# Altium project IndoorGuide_Tag_Device_V1.0.0.PrjPcb
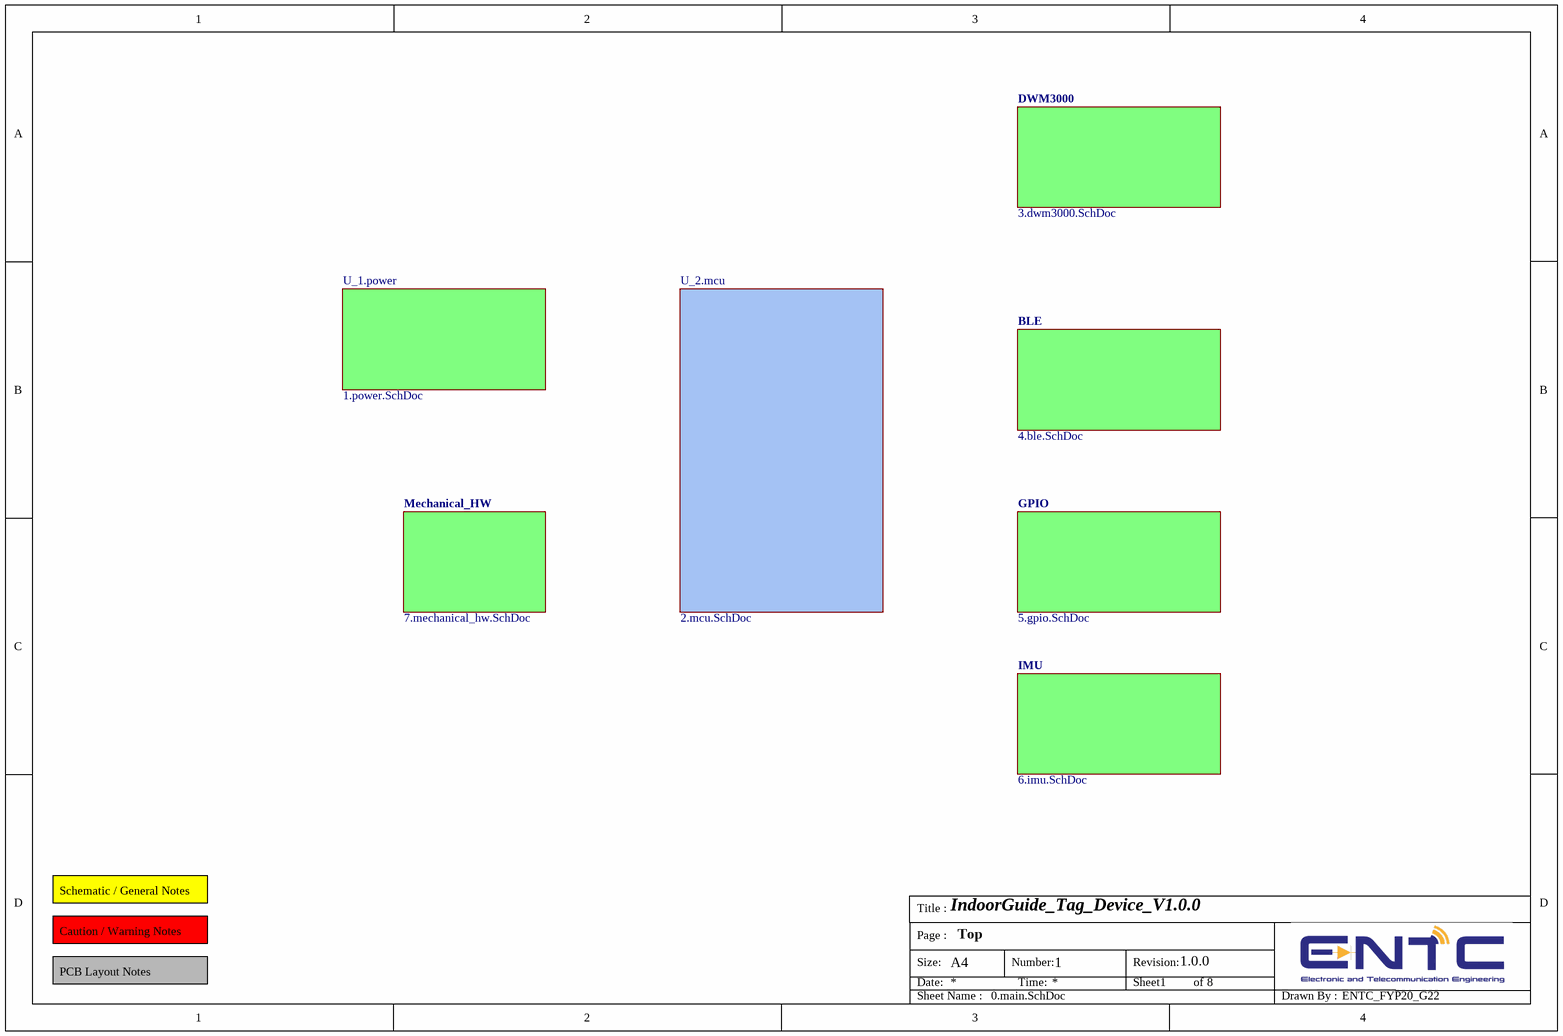
[diagram p0: 0.main.SchDoc]
Title: IndoorGuide_Tag_Device_V1.0.0; Revision: 1.0.0; Drawnby: ENTC_FYP20_G22
8 sheets, 100 parts. Net scope: hierarchical (ports join the sheet entries above them; power ports are global).
Sheets:
  0.main.SchDoc
    U_1.power = 1.power.SchDoc
    U_2.mcu = 2.mcu.SchDoc
    DWM3000 = 3.dwm3000.SchDoc
    BLE = 4.ble.SchDoc
    GPIO = 5.gpio.SchDoc
    IMU = 6.imu.SchDoc
    Mechanical_HW = 7.mechanical_hw.SchDoc

## Sheet 0.main.SchDoc: IndoorGuide_Tag_Device_V1.0.0
size A4; Organization: ORGANIZATION; Address1: ADDRESS 1; Address2: ADDRESS 2; Address3: ADDRESS 3; Address4: ADDRESS 4; DocumentNumber: 1; SheetNumber: 1; SheetTotal: 8; ENG_APP_DATE: --/--/--; DSN_APP_DATE: --/--/--; CHK_APP_DATE: --/--/--; Page: Top

### Sub-sheets
BLE = 4.ble.SchDoc: no entries
DWM3000 = 3.dwm3000.SchDoc: no entries
GPIO = 5.gpio.SchDoc: no entries
IMU = 6.imu.SchDoc: no entries
Mechanical_HW = 7.mechanical_hw.SchDoc: no entries
U_1.power = 1.power.SchDoc: no entries
U_2.mcu = 2.mcu.SchDoc: no entries

### Notes on the sheet
- Schematic / General Notes
- Caution / Warning Notes
- PCB Layout Notes
- Title :
- Size:
- Date:
- Page :
- A4
- Number:
- Time:
- Revision:
- Sheet
- of
- Sheet Name :
- Drawn By :

## Sheet 1.power.SchDoc: IndoorGuide_Tag_Device_V1.0.0
size A4; Organization: ORGANIZATION; Address1: ADDRESS 1; Address2: ADDRESS 2; Address3: ADDRESS 3; Address4: ADDRESS 4; DocumentNumber: 2; SheetNumber: 2; SheetTotal: 8; ENG_APP_DATE: --/--/--; DSN_APP_DATE: --/--/--; CHK_APP_DATE: --/--/--; Page: Power; SPICEModelCacheBQMAEVYU: <root> / <DocumentId>BQMAEVYU</DocumentId> / <CacheFrame Number="0"> / <Model Name="irf9510" Kind="CKT"> / <Text>*IRF9510  MCE  4-2-96 / *100V  4A  1.2 ohms HEXFET pkg:TO-220 2,1,3 / .SUBCKT IRF9510  10 20 40 40 / M1   1  2  3  3  DMOS L=1U W=1U / RD  10  1  .569 / RS  30  3  31M / RG  20  2  37.5 / CGS  2  3  182P / EGD 12  0  1  2  1 / VFB 14  0  0 / FFB  1  2  VFB  1 / CGD 13 14  231P / R1  13  0  1 / D1  12 13  DLIM / DDG 15 14  DCGD / R2  12 15  1 / D2  15  0  DLIM / DSD 10  3  DSUB / LS  30 40  7.5N / .MODEL DMOS PMOS (LEVEL=3 THETA=60M VMAX=208K ETA=2M VTO=-3 KP=.471) / .MODEL DCGD D (CJO=231P VJ=.6 M=.68) / .MODEL DSUB D (IS=16.6N N=1.5 RS=1.18 BV=100 CJO=327P VJ=.8 M=.42 TT=82N) / .MODEL DLIM D (IS=100U) / .ENDS IRF9510</Text> / </Model> / </CacheFrame> / </root>
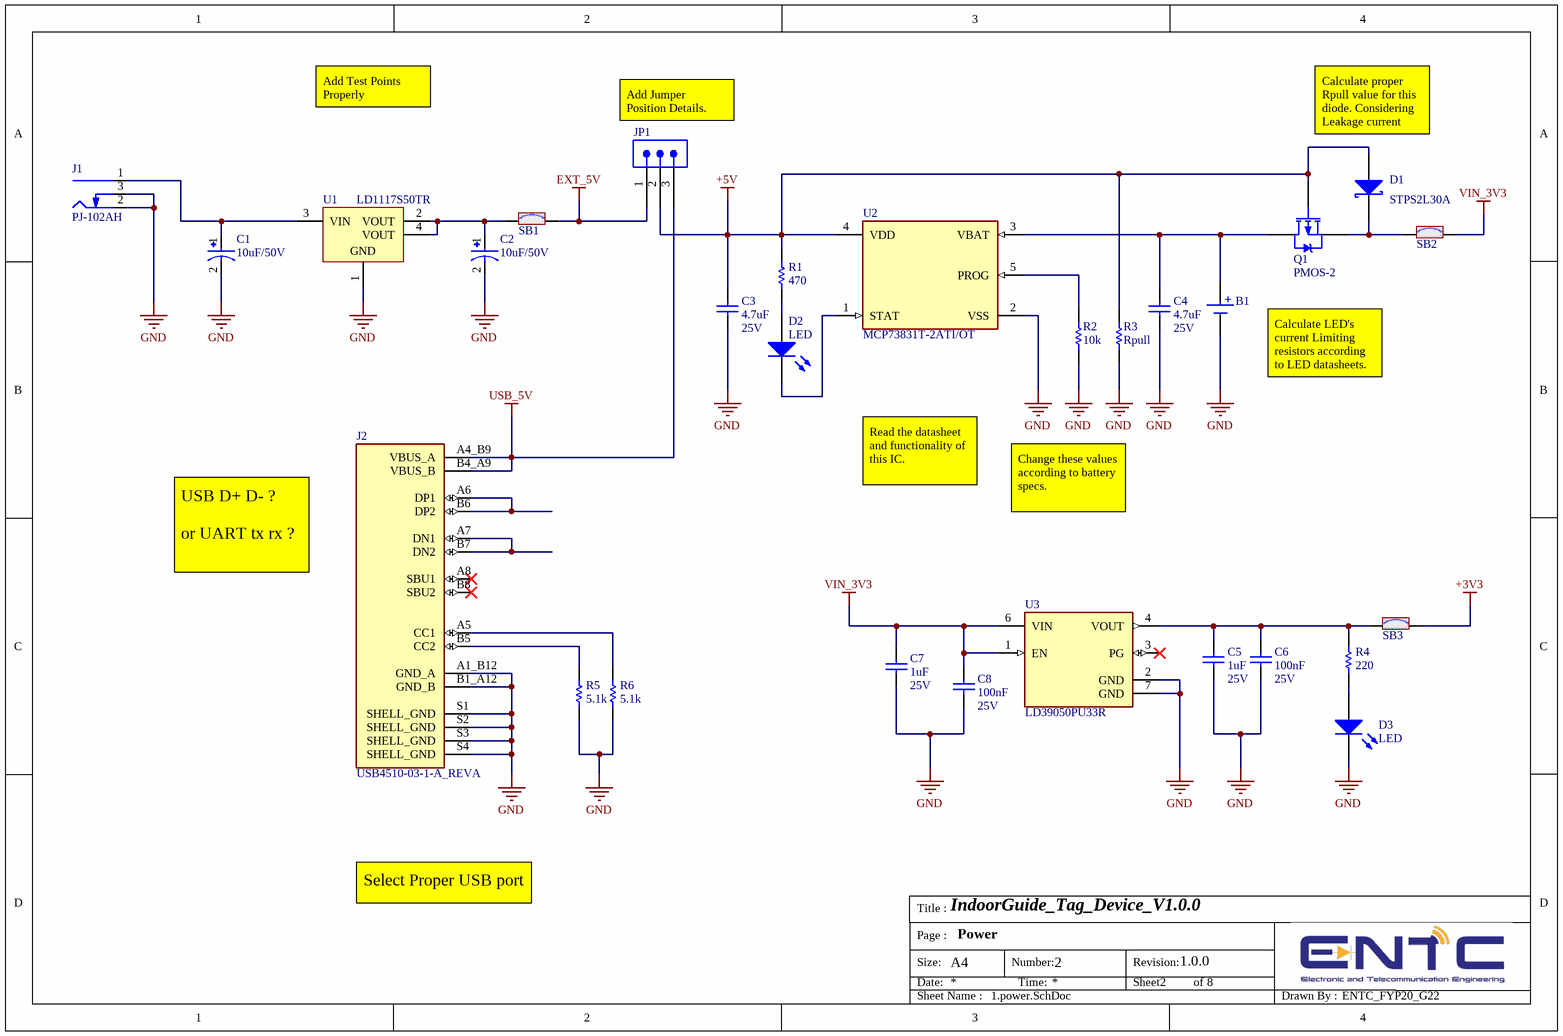
[diagram p1: 1.power.SchDoc]

### Parts
B1  (no value)  [18650_BATTERY_HOLDER]
C1  10uF/50V  [CAP1411]
C2  10uF/50V  [CAP1411]
C3  4.7uF  Voltage Rating: 25V  [cap0603]
C4  4.7uF  Voltage Rating: 25V  [cap0603]
C5  1uF  Voltage Rating: 25V  [cap0603]
C6  100nF  Voltage Rating: 25V  [cap0603]
C7  1uF  Voltage Rating: 25V  [cap0603]
C8  100nF  Voltage Rating: 25V  [cap0603]
D1  STPS2L30A
D2  LED  [LED0603]
D3  LED  [LED0603]
J1  PJ-102AH  [PJ-102AH]
J2  USB4510-03-1-A_REVA  [GCT_USB4510-03-1-A_REVA]
JP1  (no value)  [HEADER_FEMALE_3POS_P2.54MM]
Q1  PMOS-2  [TO-220AB]
R1  470  [RES0402]
R2  10k  [RES0402]
R3  Rpull  [RES0402]
R4  220  [RES0402]
R5  5.1k  [RES0402]
R6  5.1k  [RES0402]
SB1  SB_ON  [SOLDER-BRIDGE_R0603-0R]  (value not drawn)
SB2  SB_ON  [SOLDER-BRIDGE_R0603-0R]  (value not drawn)
SB3  SB_ON  [SOLDER-BRIDGE_R0603-0R]  (value not drawn)
U1  LD1117S50TR  [SOT-223_M]
U2  MCP73831T-2ATI/OT  [SOT95P280X145-5N]
U3  LD39050PU33R  [SON95P300X300X100-7N]

### Nets
+3V3: SB3.2
+5V: C3.2 D1.1(A) JP1.2 Q1.1(G) R1.2 R3.2 U2.4(VDD)
EXT_5V: JP1.1 SB1.2
GND: B1.2(-) C1.2 C2.2 C3.1 C4.1 C5.1 C6.1 C7.1 C8.1 D3.2(K) J1.2(Outer) J1.3(SW) J2.A1_B12(GND_A) J2.B1_A12(GND_B) J2.S1(SHELL_GND) J2.S2(SHELL_GND) J2.S3(SHELL_GND) J2.S4(SHELL_GND) R2.1 R3.1 R5.1 R6.1 U1.1(GND) U2.2(VSS) U3.2(GND) U3.7(GND)
USB_5V: J2.A4_B9(VBUS_A) J2.B4_A9(VBUS_B) JP1.3
VIN_3V3: C7.2 C8.2 SB2.2 U3.1(EN) U3.6(VIN)
NetB1_1: B1.1(+) C4.2 Q1.2(D) U2.3(VBAT)
NetC1_1: C1.1 J1.1(Centre) U1.3(VIN)
NetC2_1: C2.1 SB1.1 U1.2(VOUT) U1.4(VOUT)
NetC5_2: C5.2 C6.2 R4.2 SB3.1 U3.4(VOUT)
NetD1_2: D1.2(K) Q1.3(S) SB2.1
NetD2_1: D2.1(A) R1.1
NetD2_2: D2.2(K) U2.1(STAT)
NetD3_1: D3.1(A) R4.1
NetJ2_A5: J2.A5(CC1) R6.2
NetJ2_A6: J2.A6(DP1) J2.B6(DP2)
NetJ2_A7: J2.A7(DN1) J2.B7(DN2)
NetJ2_B5: J2.B5(CC2) R5.2
NetR2_2: R2.2 U2.5(PROG)

Not connected (* = marked no-connect by the designer): J2 A8(SBU1)* B8(SBU2)*; U3 3(PG)*

### Notes on the sheet
- Add Test Points Properly
- (near JP1) Add Jumper Position Details.
- Calculate proper Rpull value for this diode. Considering Leakage current
- Calculate LED's current Limiting resistors according to LED datasheets.
- Read the datasheet and functionality of this IC.
- Change these values according to battery specs.
- USB D+ D- ?
  or UART tx rx ?
- Select Proper USB port
- Title :
- Size:
- Date:
- Page :
- A4
- Number:
- Time:
- Revision:
- Sheet
- of
- Sheet Name :
- Drawn By :

### Library data of the parts
B1 = Battery_2: BATTERY HOLDER 18650 PC PIN; Part Number: 1043; Manufacturer: Keystone Electronics; Battery Cell Size: 18650; Battery Type, Function: Cylindrical, Holder; Number of Cells: 1; Style: Holder (Open); ComponentLink1Description: Datasheet; ComponentLink1URL: http://keyelco.com/userAssets/file/M65p27.pdf; ComponentLink2Description: DigiKey Link; ComponentLink2URL: http://digikey.com/product-detail/en/keystone-electronics/1043/36-1043-ND/2745669; Height Above Board: 0.585" (14.86mm); LastUpdated: 2/2/2020 9:19:56 AM; Lifecycle Status: Active; Minimum Order: 1; Mounting Type: PCB, Through Hole; Operating Temperature: -50°C ~ 145°C; Packaging: Unknown; PartId: 2; Part Status: Active; Price: 2.58; Series: -; Supplier 1: DigiKey; Supplier Part Number 1: 36-1043-ND; Termination Style: PC Pin
C1 C2 = Cap Pol: Polarized capacitor; Manufacturer: *; Manufacturer part number: *; JLCPCB part number: *
C3-C8 = Cap: Capacitor; MF: *; MP: *; JLCPCB: *
D1 = D Schottky: 30V 450mV@2A 2A SMA(DO-214AC) Schottky Diodes ROHS; MF: STMicroelectronics; MP: STPS2L30A; JLCPCB: C133102
D2 D3 = LED: Light Emitting Diode; Manufacturer: *; Manufacturer part number: *; JLCPCB part number: *
J1 = Barrel_Connector: CONN PWR JACK 2X5.5MM SOLDER; Manufacturer: CUI Devices; Actual Diameter: 0.079" (2.00mm ID), 0.256" (6.50mm OD); Current Rating (Amps): 5A; Gender: Male; Industry Recognized Mating Diameter: 2.00mm ID (0.079"), 5.50mm OD (0.217"); Internal Switch(s): Single Switch, Normally Closed; Material Flammability Rating: UL94 V-0; Mating Length/Depth: 0.354" (9.00mm); Number of Positions/Contacts: 2 Conductors, 3 Contacts; Shielding: Unshielded; Voltage - Rated: 24VDC; Part Number: PJ-102AH; ComponentLink1Description: Datasheet; ComponentLink1URL: https://www.cuidevices.com/product/resource/digikeypdf/pj-102ah.pdf; ComponentLink2Description: DigiKey Link; ComponentLink2URL: //digikey.com/product-detail/en/cui-devices/PJ-102AH/CP-102AH-ND/408448; Connector Type: Jack; LastUpdated: 12/16/2019 7:01:27 PM; Lifecycle Status: 0; Minimum Order: 1; Mounting Type: Through Hole, Right Angle; Packaging: Tray; Part Status: Active; Price: 0.76; Series: -; Supplier 1: DigiKey; Supplier Part Number 1: CP-102AH-ND; Termination: Solder
J2 = USB4510-03-1-A_REVA: USB-C (USB TYPE-C) Receptacle Connector 24 (16+8 Dummy) Position Board Edge, Cutout; Surface Mount; Through Hole, Right Angle; Manufacturer: On Shore Technology Inc.; Manufacturer part number: USB-CC16HMWTR; Digikey part number: 52-USB-CC16HMWTR
JP1 = 3 Pin Jumper: Part Number: NC6-P108-03; Manufacturer: TE Connectivity AMP Connectors; Barrier Type: 2 Wall (Dual); Bottom Termination: PC Pin; Current Rating (Amps): 20A; Number of Circuits: 3; Pitch: 0.375" (9.53mm); Top Termination: Screws with Captive Plate; Voltage Rating: 300V; Wire Gauge: 12-22 AWG; Color: Black; ComponentLink1Description: Datasheet; ComponentLink1URL: https://www.te.com/commerce/DocumentDelivery/DDEController?Action=srchrtrv&DocNm=3-1437664-0&DocType=Customer+Drawing&DocLang=English; ComponentLink2Description: DigiKey Link; ComponentLink2URL: http://digikey.com/product-detail/en/te-connectivity-amp-connectors/NC6-P108-03/A98496-ND/1277927; LastUpdated: 1/15/2020 4:12:05 AM; Lifecycle Status: Active; Minimum Order: 1; Number of Rows: 1; Number of Wire Entries: 3; Packaging: Bulk; Part Status: Active; Price: 2.16; Series: NC6, Buchanan; Supplier 1: DigiKey; Supplier Part Number 1: A98496-ND; Terminal Block Type: Barrier Block
Q1 = PMOS-2: P-Channel Power MOSFET; Note: Pin 4 not drawn and electrically connected to Pin 2.; Published: 8-Jun-2000; LatestRevisionDate: 17-Jul-2002; LatestRevisionNote: Re-released for DXP Platform.; DatasheetVersion: PD-9.390D; PackageVersion: Feb-1997; PackageReference: TO-220AB; Publisher: Altium Limited; PackageDescription: TO, Thru-Hole, Vertical, Heatsink Mounted; 3 In-Line Leads; Pitch 2.54 mm; ComponentLink1Description: Manufacturer Link; ComponentLink1URL: http://www.irf.com/
R1-R6 = Res: Resistor; Manufacturer: *; Manufacturer part number: *; JLCPCB part number: *
SB1-SB3 = SB_ON: Solder Bridge ON; Internal_Part_Number: MCD-00071; Part_Type: Mechanical; Provided_By: Subcon; Initial_Board_Reference: mb1274; MP: PMR03EZPJ000; ECCN_US: n/a; ECCN_EU: n/a; Status: Released; JLCPCB: C253507
U1 = CMP-0244-00312-1: Fixed Low Drop Positive Voltage Regulator, 5V, 4-Pin SOT-223, Tape and Reel; ComponentLink1URL: http://www.st.com; DatasheetVersion: 1/11/2011; PackageDescription: 4-Pin SOT-223 Package, 6.5 x 3.5 mm Body, 2.3 mm Pitch, 7 mm Lead Span; ComponentLink2URL: http://www.st.com/internet/com/TECHNICAL_RESOURCES/TECHNICAL_LITERATURE/DATASHEET/CD00000544.pdf; ComponentLink1Description: Manufacturer URL; PackageReference: SOT-223; PackageVersion: 2010; ComponentLink2Description: Datasheet
U2 = MCP73831T-2ATI/OT: Microchip MCP73831T-2ATI/OT, Battery Charge Controller, 500mA, 5-Pin SOT-23 | Microchip Technology Inc. MCP73831T-2ATI/OT; SnapEDA_Link: https://www.snapeda.com/parts/MCP73831T-2ATI/OT/Microchip/view-part/?ref=snap; Package: SOT-23 Microchip; Value: *; MF: Microchip; MP: MCP73831T-2ATI/OT; Check_prices: https://www.snapeda.com/parts/MCP73831T-2ATI/OT/Microchip/view-part/?ref=eda
U3 = LD39050PU33R: Linear Voltage Regulator IC Positive Fixed 1 Output 500mA 6-DFN (3x3); MF: STMicroelectronics; SnapEDA_Link: https://www.snapeda.com/parts/LD39050PU33R/STMicroelectronics/view-part/?ref=snap; Package: DFN-6 STMicroelectronics; Value: *; MP: LD39050PU33R; Check_prices: https://www.snapeda.com/parts/LD39050PU33R/STMicroelectronics/view-part/?ref=eda

## Sheet 2.mcu.SchDoc: IndoorGuide_Tag_Device_V1.0.0
size A4; Organization: ORGANIZATION; Address1: ADDRESS 1; Address2: ADDRESS 2; Address3: ADDRESS 3; Address4: ADDRESS 4; DocumentNumber: 3; SheetNumber: 3; SheetTotal: 7; ENG_APP_DATE: --/--/--; DSN_APP_DATE: --/--/--; CHK_APP_DATE: --/--/--; Page: MCU; SPICEModelCacheMCBEDDJI: <root> / <DocumentId>MCBEDDJI</DocumentId> / <CacheFrame Number="0"> / <Model Name="xtal" Kind="CKT"> / <Text>*Generic type:crystal pkg:HC33/51 / .SUBCKT XTAL 1 2 PARAMS: FREQ=1Meg RS=750 C=13pf Q=1000 / LX 1 3 {((Q*RS)/(6.2831852*FREQ))} IC=0.5M / CX 3 4 {(1/(Q*6.2831852*FREQ*RS))} / C0 1 2 {C} / RS 4 2 {RS} / .ENDS XTAL</Text> / </Model> / </CacheFrame> / </root>
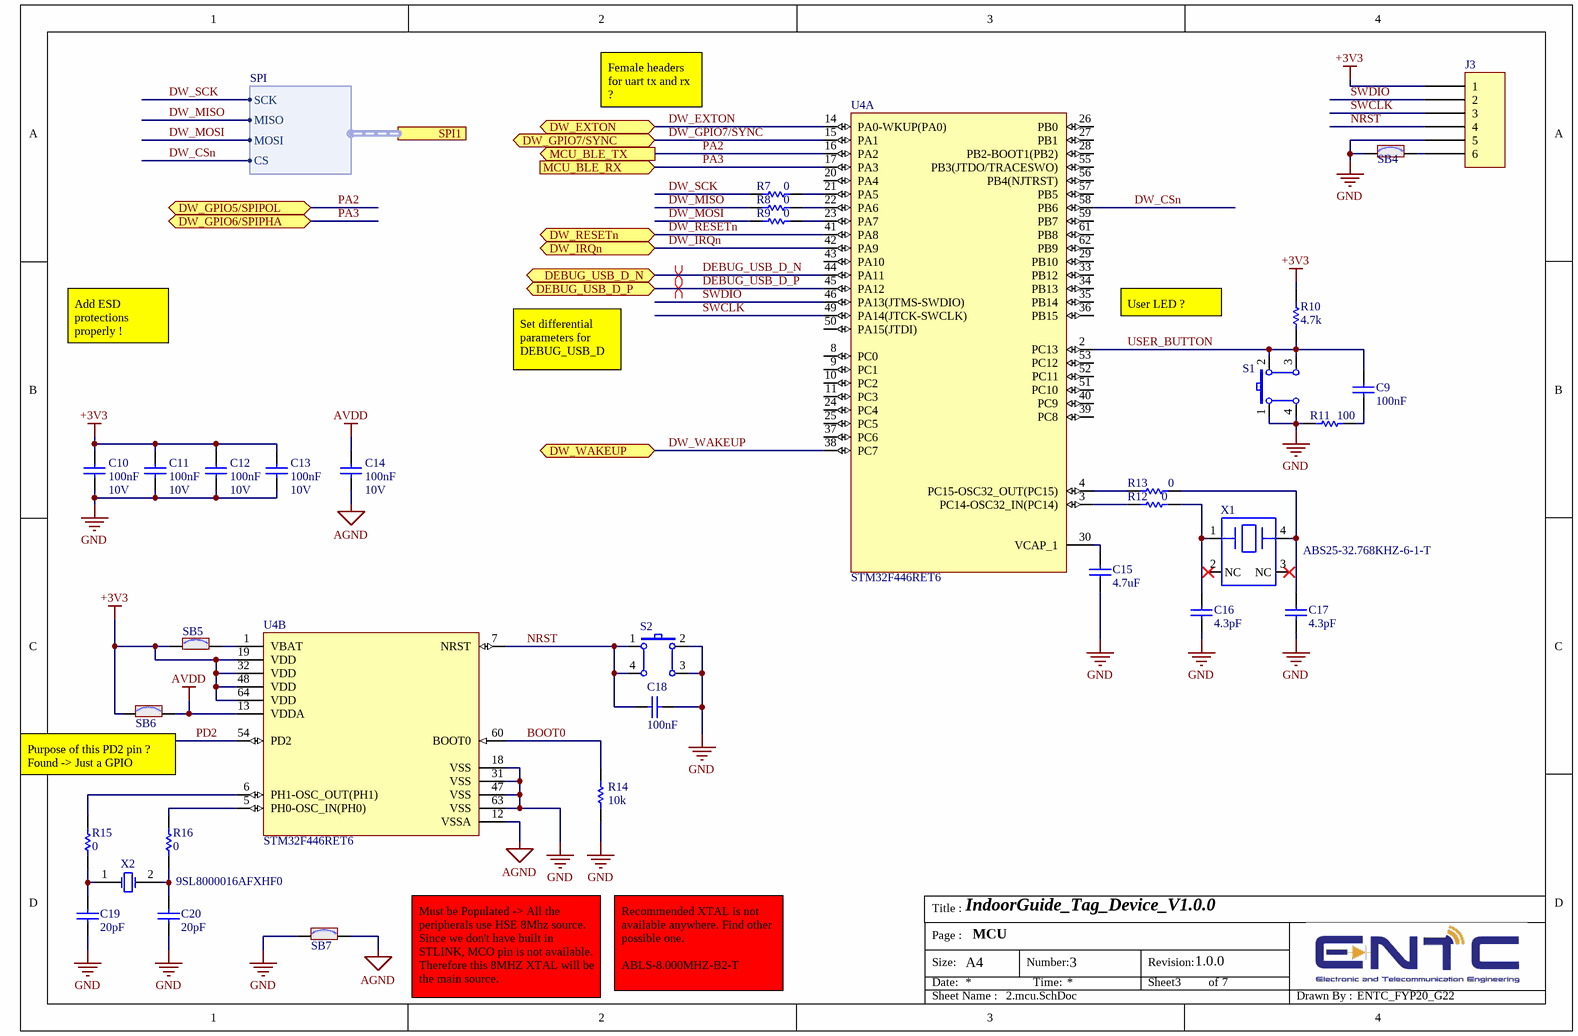
[diagram p2: 2.mcu.SchDoc]

### Parts
C9  100nF  [cap0603]
C10  100nF  Voltage Rating: 10V  [cap0603]
C11  100nF  Voltage Rating: 10V  [cap0603]
C12  100nF  Voltage Rating: 10V  [cap0603]
C13  100nF  Voltage Rating: 10V  [cap0603]
C14  100nF  Voltage Rating: 10V  [cap0603]
C15  4.7uF  [cap0603]
C16  4.3pF  [cap0603]
C17  4.3pF  [cap0603]
C18  100nF  [cap0603]
C19  20pF  [cap0603]
C20  20pF  [cap0603]
J3  (no value)  [HEADER_FEMALE_6POS_P2.54MM]
R7  0  [RES0402]
R8  0  [RES0402]
R9  0  [RES0402]
R10  4.7k  [RES0402]
R11  100  [RES0402]
R12  0  [RES0402]
R13  0  [RES0402]
R14  10k  [RES0402]
R15  0  [RES0402]
R16  0  [RES0402]
S1  (no value)
S2  (no value)
SB4  SB_ON  [SOLDER-BRIDGE_R0603-0R]  (value not drawn)
SB5  SB_ON  [SOLDER-BRIDGE_R0603-0R]  (value not drawn)
SB6  SB_ON  [SOLDER-BRIDGE_R0603-0R]  (value not drawn)
SB7  SB_ON  [SOLDER-BRIDGE_R0603-0R]  (value not drawn)
U4  STM32F446RET6  (parts A,B of 2)
X1  ABS25-32.768KHZ-6-1-T  [FP-ABS25-MFG]
X2  9SL8000016AFXHF0  [R38]

### Ports
DEBUG_USB_D_N (bidir), DEBUG_USB_D_P (bidir), DW_EXTON (bidir), DW_GPIO5/SPIPOL (bidir), DW_GPIO6/SPIPHA (bidir), DW_GPIO7/SYNC (bidir), DW_IRQn (bidir), DW_RESETn (bidir), DW_WAKEUP (bidir), MCU_BLE_RX (in), MCU_BLE_TX (out), SPI1 (harness SPI)

### Harnesses
SPI: SCK, MISO, MOSI, CS

### Nets
+3V3: C10.2 C11.2 C12.2 C13.2 J3.1 R10.2 SB5.1 SB6.1 U4.19(VDD) U4.32(VDD) U4.48(VDD) U4.64(VDD)
AGND: C14.1 SB7.2 U4.12(VSSA)
AVDD: C14.2 SB6.2 U4.13(VDDA)
GND: C10.1 C11.1 C12.1 C13.1 C15.1 C16.1 C17.1 C18.1 C19.1 C20.1 J3.5 R11.2 R14.1 S1.1 S1.4 S2.2 S2.3 SB4.1 SB7.1 U4.18(VSS) U4.31(VSS) U4.47(VSS) U4.63(VSS)
BOOT0: R14.2 U4.60(BOOT0)
DEBUG_USB_D_N: U4.44(PA11) ; port DEBUG_USB_D_N
DEBUG_USB_D_P: U4.45(PA12) ; port DEBUG_USB_D_P
DW_CSn: U4.58(PB6) ; port SPI1.CS
DW_EXTON: U4.14(PA0-WKUP(PA0)) ; port DW_EXTON
DW_GPIO7/SYNC: U4.15(PA1) ; port DW_GPIO7/SYNC
DW_IRQn: U4.42(PA9) ; port DW_IRQn
DW_MISO: R8.2 ; port SPI1.MISO
DW_MOSI: R9.2 ; port SPI1.MOSI
DW_RESETn: U4.41(PA8) ; port DW_RESETn
DW_SCK: R7.2 ; port SPI1.SCK
DW_WAKEUP: U4.38(PC7) ; port DW_WAKEUP
NRST: C18.2 J3.4 S2.1 S2.4 U4.7(NRST)
PA2: U4.16(PA2) ; port MCU_BLE_TX, port DW_GPIO5/SPIPOL
PA3: U4.17(PA3) ; port MCU_BLE_RX, port DW_GPIO6/SPIPHA
PD2: U4.54(PD2)
SWCLK: J3.3 U4.49(PA14(JTCK-SWCLK))
SWDIO: J3.2 U4.46(PA13(JTMS-SWDIO))
USER_BUTTON: C9.1 R10.1 S1.2 S1.3 U4.2(PC13)
NetC9_2: C9.2 R11.1
NetC15_2: C15.2 U4.30(VCAP_1)
NetC16_2: C16.2 R12.1 X1.1
NetC17_2: C17.2 R13.2 X1.4
NetC19_2: C19.2 R15.2 X2.1(OSC1)
NetC20_2: C20.2 R16.2 X2.2(OSC2)
NetJ3_6: J3.6 SB4.2
NetR7_1: R7.1 U4.21(PA5)
NetR8_1: R8.1 U4.22(PA6)
NetR9_1: R9.1 U4.23(PA7)
NetR12_2: R12.2 U4.3(PC14-OSC32_IN(PC14))
NetR13_1: R13.1 U4.4(PC15-OSC32_OUT(PC15))
NetR15_1: R15.1 U4.6(PH1-OSC_OUT(PH1))
NetR16_1: R16.1 U4.5(PH0-OSC_IN(PH0))
NetSB5_2: SB5.2 U4.1(VBAT)

Not connected (* = marked no-connect by the designer): U4 8(PC0) 9(PC1) 10(PC2) 11(PC3) 20(PA4) 24(PC4) 25(PC5) 26(PB0) 27(PB1) 28(PB2-BOOT1(PB2)) 29(PB10) 33(PB12) 34(PB13) 35(PB14) 36(PB15) 37(PC6) 39(PC8) 40(PC9) 43(PA10) 50(PA15(JTDI)) 51(PC10) 52(PC11) 53(PC12) 55(PB3(JTDO/TRACESWO)) 56(PB4(NJTRST)) 57(PB5) 59(PB7) 61(PB8) 62(PB9); X1 2(NC)* 3(NC)*

### Layout directives
differential pair: DEBUG_USB_D_N, DEBUG_USB_D_P

### Notes on the sheet
- Female headers for uart tx and rx ?
- User LED ?
- Add ESD protections properly !
- Set differential parameters for DEBUG_USB_D
- (near SB6) Purpose of this PD2 pin ? Found -> Just a GPIO
- Recommended XTAL is not available anywhere. Find other possible one.
  ABLS-8.000MHZ-B2-T
- Must be Populated -> All the peripherals use HSE 8Mhz source. Since we don't have built in STLINK, MCO pin is not available. Therefore this 8MHZ XTAL will be the main source.
- Title :
- Size:
- Date:
- Page :
- A4
- Number:
- Time:
- Revision:
- Sheet
- of
- Sheet Name :
- Drawn By :

### Library data of the parts
C9-C20 = Cap: Capacitor; MF: *; MP: *; JLCPCB: *
J3 = 6 Pin: CONN RCPT 6POS 0.1 GOLD PCB; Part Number: M20-7820642; Manufacturer: Harwin Inc.; Connector Type: Receptacle; Contact Length - Post: 0.118" (3.00mm); Current Rating (Amps): 3A; Mated Stacking Heights: 11.04mm, 12.63mm; Material Flammability Rating: UL94 V-0; Number of Positions: 6; Number of Positions Loaded: All; Pitch - Mating: 0.100" (2.54mm); Style: Board to Board or Cable; ComponentLink1Description: Datasheet; ComponentLink1URL: https://cdn.harwin.com/pdfs/C001XX_M20_Series_Connectors.pdf; ComponentLink2Description: DigiKey Link; ComponentLink2URL: https://www.digikey.com/en/products/detail/harwin-inc/M20-7820642/3727776; Contact Finish - Mating: Gold; Contact Finish - Post: Tin; Contact Finish Thickness - Mating: Flash; Contact Type: Female Socket; Fastening Type: Push-Pull; Insulation Color: Black; Insulation Height: 0.335" (8.51mm); LastUpdated: 9/21/2022 6:58:09 PM; Lifecycle Status: Active; Minimum Order: 1; Mounting Type: Through Hole; Number of Rows: 1; Operating Temperature: -40°C ~ 105°C; Packaging: Tube; Part Status: Active; Price: 0.55; Series: M20; Supplier 1: DigiKey; Supplier Part Number 1: 952-1808-ND; Termination: Solder
R7-R16 = Res: Resistor; Manufacturer: *; Manufacturer part number: *; JLCPCB part number: *
S1 S2 = SPST-NO 4 PIN: Switch Push button
SB4-SB7 = SB_ON: as SB1 on sheet 1.power; ECCN_US: n/a; ECCN_EU: n/a; Status: Released; JLCPCB: C253507
U4 = MC-ARM-STM32F446-LQFP64: ARM Cortex-M4 32-bit MCU+FPU, 512 KB Flash, 128 KB Internal RAM, 50 I/Os, 64-Pin LQFP, -40 to 85 degC, Tray; I/Os (High Current): 50; Supply Voltage(Vcc) min (V): 1.7; Operating Frequency(F) (Processor speed) (MHz): 180; D/A Converter: 2; Internal RAM Size (kB): 128; FLASH Size (Prog) (kB): 512; Core: ARM Cortex-M4; ComponentLink1Description: Manufacturer URL; Package Reference: 64-Pin Low-profile Quad Flat Package, Body 10 x 10 mm, Pitch 0.5 mm; ComponentLink2URL: http://www.st.com/st-web-ui/static/active/en/resource/technical/document/datasheet/DM00141306.pdf; Packing: Tray; DatasheetVersion: Rev. 6; ComponentLink1URL: http://www.st.com/; ComponentLink2Description: Datasheet; Package Description: LQFP64; Mounting Technology: Surface Mount
X1 = 28be33c29b20f54059194caee89ade4: CRYSTAL 32.7680KHZ 6PF SMD; ESR (Equivalent Series Resistance): 50kR; Frequency Tolerance: 10ppm; Series Resistance: 50kR; Frequency: 32.768kHz; Length: 8mm; Load Capacitance: 6pF; Packaging: Tape and Reel; Radiation Hardening: No; Min Operating Temperature: -40°C; Lead Free: Lead Free; Height: 0.098inch; Termination: SMD/SMT; Case/Package: SMD/SMT; Max Operating Temperature: 85°C; Mount: Surface Mount; Depth: 3.8mm; RoHS Compliant: Yes; Series: ABS25; Package Quantity: 3000; Operating Frequency: 32.768 kHz; Number of Pins: 4; Tolerance: 10ppm; Width: 0.15inch; REACH SVHC: No SVHC
X2 = XTAL: 8MHz(16pF) DIP package; Published: 8-Jun-2000; LatestRevisionDate: 17-Jul-2002; LatestRevisionNote: Re-released for DXP Platform.; PackageReference: R38; Publisher: Altium Limited; PackageDescription: Crystal, Thru-Hole; 2 Leads; Body 3.1 x 8.2 mm (Dia.xH)

## Sheet 3.dwm3000.SchDoc: IndoorGuide_Tag_Device_V1.0.0
size A4; Organization: ORGANIZATION; Address1: ADDRESS 1; Address2: ADDRESS 2; Address3: ADDRESS 3; Address4: ADDRESS 4; DocumentNumber: 4; SheetNumber: 4; SheetTotal: 7; ENG_APP_DATE: --/--/--; DSN_APP_DATE: --/--/--; CHK_APP_DATE: --/--/--; Page: DW3000
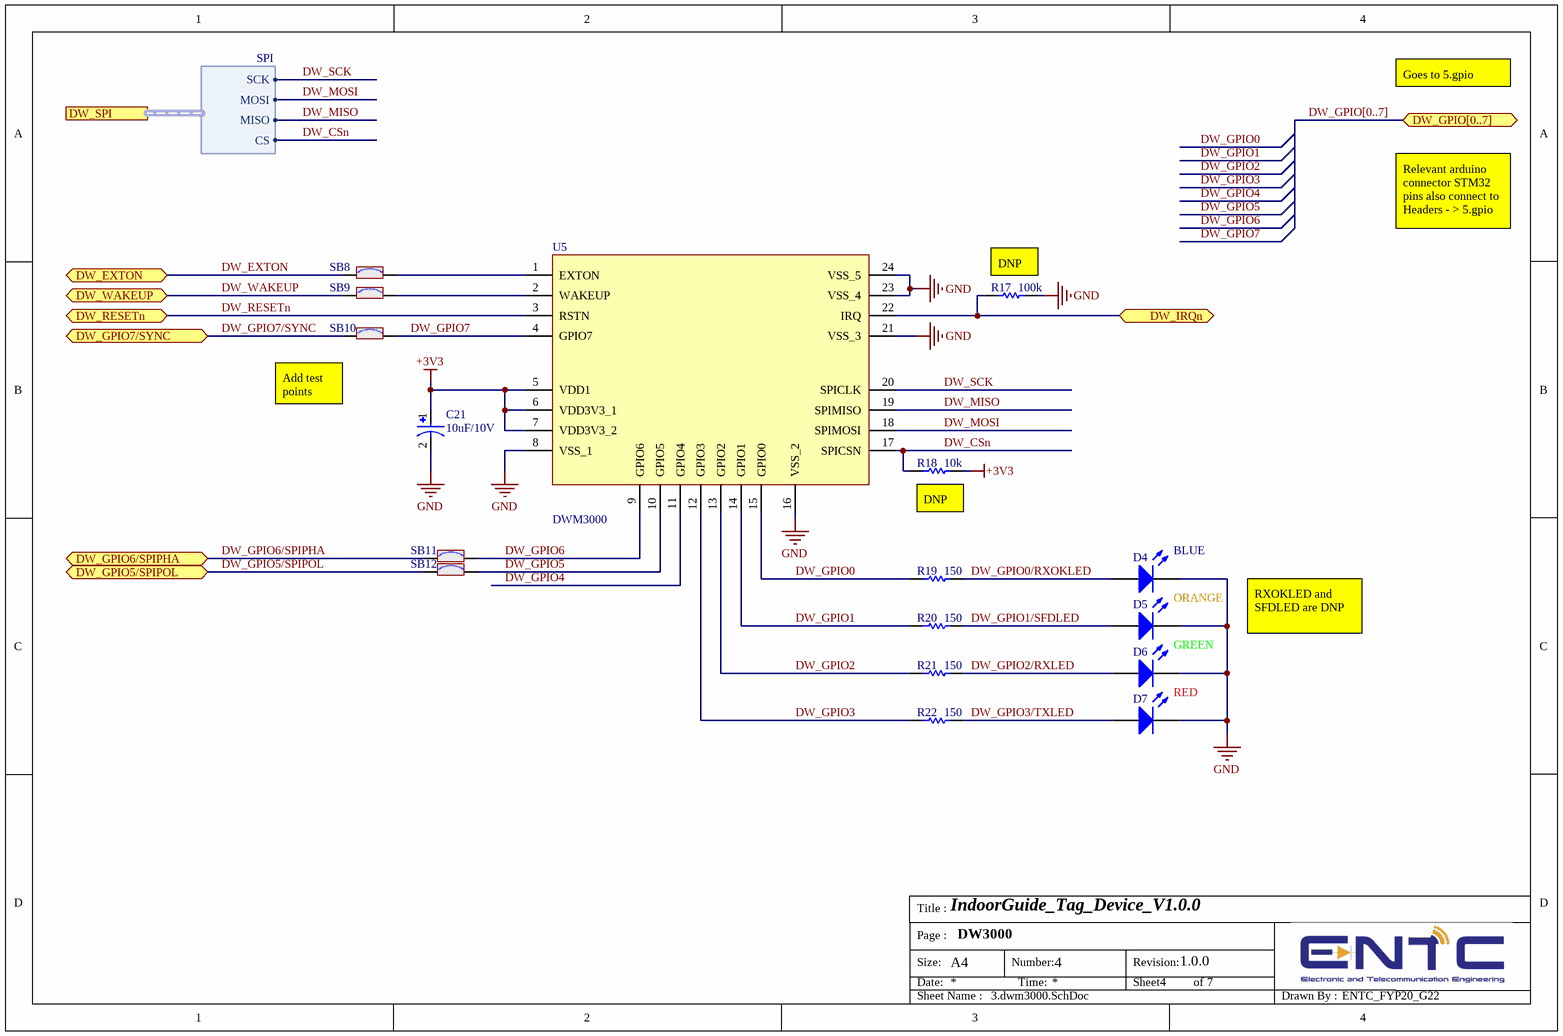
[diagram p3: 3.dwm3000.SchDoc]

### Parts
C21  10uF/10V  [CAP1411]
D4  BLUE  [LED0603]
D5  ORANGE  [LED0603]
D6  GREEN  [LED0603]
D7  RED  [LED0603]
R17  100k  [RES0402]
R18  10k  [RES0402]
R19  150  [RES0402]
R20  150  [RES0402]
R21  150  [RES0402]
R22  150  [RES0402]
SB8  SB_ON  [SOLDER-BRIDGE_R0603-0R]  (value not drawn)
SB9  SB_ON  [SOLDER-BRIDGE_R0603-0R]  (value not drawn)
SB10  SB_ON  [SOLDER-BRIDGE_R0603-0R]  (value not drawn)
SB11  SB_ON  [SOLDER-BRIDGE_R0603-0R]  (value not drawn)
SB12  SB_ON  [SOLDER-BRIDGE_R0603-0R]  (value not drawn)
U5  DWM3000  [DWM3000]

### Ports
DW_EXTON (bidir), DW_GPIO5/SPIPOL (bidir), DW_GPIO6/SPIPHA (bidir), DW_GPIO7/SYNC (bidir), DW_GPIO[0..7] (bidir), DW_IRQn (bidir), DW_RESETn (bidir), DW_SPI (harness SPI), DW_WAKEUP (bidir)

### Harnesses
SPI: CS, MISO, MOSI, SCK

### Nets
+3V3: C21.1 R18.2 U5.5(VDD1) U5.6(VDD3V3_1) U5.7(VDD3V3_2)
GND: C21.2 D4.2(K) D5.2(K) D6.2(K) D7.2(K) R17.1 U5.8(VSS_1) U5.16(VSS_2) U5.21(VSS_3) U5.23(VSS_4) U5.24(VSS_5)
DW_CSn: R18.1 U5.17(SPICSN) ; port DW_SPI.CS
DW_EXTON: SB8.1 ; port DW_EXTON
DW_GPIO0: R19.2 U5.15(GPIO0)
DW_GPIO0/RXOKLED: D4.1(A) R19.1
DW_GPIO1: R20.2 U5.14(GPIO1)
DW_GPIO1/SFDLED: D5.1(A) R20.1
DW_GPIO2: R21.2 U5.13(GPIO2)
DW_GPIO2/RXLED: D6.1(A) R21.1
DW_GPIO3: R22.2 U5.12(GPIO3)
DW_GPIO3/TXLED: D7.1(A) R22.1
DW_GPIO4: U5.11(GPIO4)
DW_GPIO5: SB12.2 U5.10(GPIO5)
DW_GPIO5/SPIPOL: SB12.1 ; port DW_GPIO5/SPIPOL
DW_GPIO6: SB11.2 U5.9(GPIO6)
DW_GPIO6/SPIPHA: SB11.1 ; port DW_GPIO6/SPIPHA
DW_GPIO7: SB10.2 U5.4(GPIO7)
DW_GPIO7/SYNC: SB10.1 ; port DW_GPIO7/SYNC
DW_MISO: U5.19(SPIMISO) ; port DW_SPI.MISO
DW_MOSI: U5.18(SPIMOSI) ; port DW_SPI.MOSI
DW_RESETn: U5.3(RSTN) ; port DW_RESETn
DW_SCK: U5.20(SPICLK) ; port DW_SPI.SCK
DW_WAKEUP: SB9.1 ; port DW_WAKEUP
NetR17_2: R17.2 U5.22(IRQ) ; port DW_IRQn
NetSB8_2: SB8.2 U5.1(EXTON)
NetSB9_2: SB9.2 U5.2(WAKEUP)

### Buses and harness runs
bus DW_GPIO[0..7] = port DW_GPIO[0..7]

### Notes on the sheet
- Goes to 5.gpio
- Relevant arduino connector STM32 pins also connect to Headers - > 5.gpio
- (near R17) DNP
- (near SB10) Add test points
- (near R18) DNP
- RXOKLED and SFDLED are DNP
- Title :
- Size:
- Date:
- Page :
- A4
- Number:
- Time:
- Revision:
- Sheet
- of
- Sheet Name :
- Drawn By :

### Library data of the parts
C21 = Cap Pol: Polarized capacitor; Manufacturer: *; Manufacturer part number: *; JLCPCB part number: *
D4-D7 = LED: Light Emitting Diode; Manufacturer: *; Manufacturer part number: *; JLCPCB part number: *
R17-R22 = Res: Resistor; Manufacturer: *; Manufacturer part number: *; JLCPCB part number: *
SB8-SB12 = SB_ON: as SB1 on sheet 1.power; ECCN_US: n/a; ECCN_EU: n/a; Status: Released; JLCPCB: C253507
U5 = DWM3000: 6.5 & 8.0 GHz Ultra-Wideband (UWB) Module,Supply voltage: 2.5 to 3.6 V (VDD3V3), 1.62 to 3.6 V (VDD1).; Manufacturer_Name: Qorvo; Geometry.Height: 2.89mm; Manufacturer_Part_Number: DWM3000; Mouser Part Number: N/A; Mouser Price/Stock: https://www.mouser.co.uk/ProductDetail/Qorvo/DWM3000?qs=iLbezkQI%252BsgcUwU6rIS9AQ%3D%3D; Arrow Part Number: *; Arrow Price/Stock: *; Datasheet Link: https://www.qorvo.com/products/p/DWM3000#documents

## Sheet 4.ble.SchDoc: IndoorGuide_Tag_Device_V1.0.0
size A4; DocumentNumber: 5; SheetNumber: 5; SheetTotal: 8; Page: Ble_module
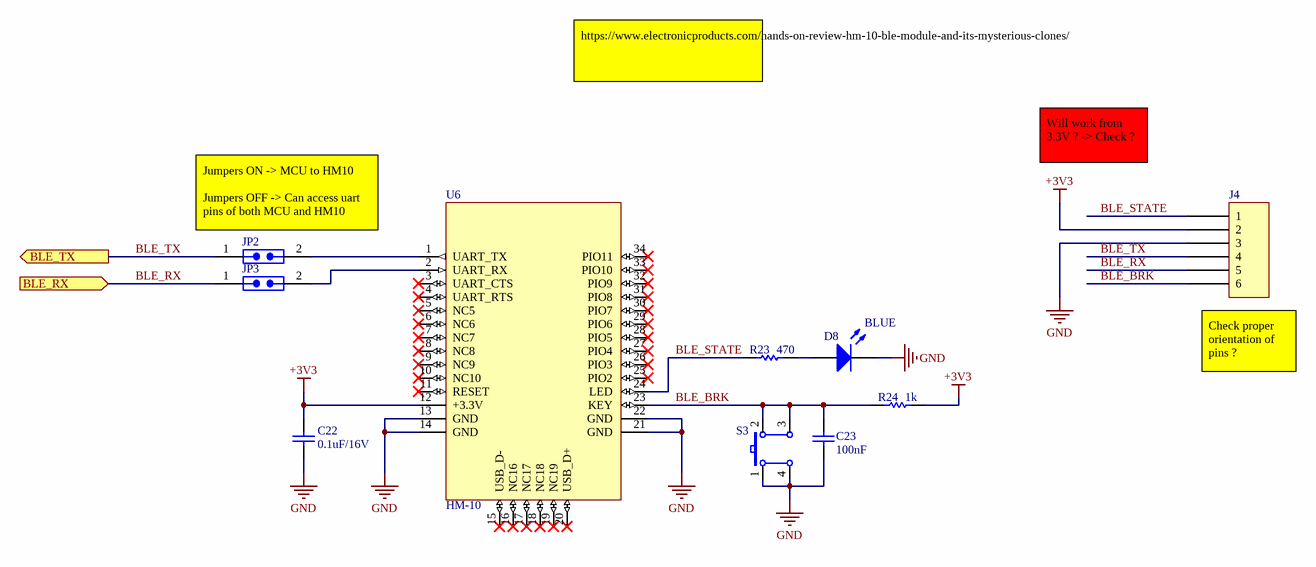
[diagram p4: 4.ble.SchDoc]

### Parts
C22  0.1uF/16V  [cap0603]
C23  100nF  [cap0603]
D8  BLUE  [LED0603]
J4  (no value)  [HEADER_FEMALE_6POS_P2.54MM]
JP2  (no value)
JP3  (no value)
R23  470  [RES0402]
R24  1k  [RES0402]
S3  (no value)
U6  HM-10  [26.9X13X2.2_BOARD]

### Ports
BLE_RX (in), BLE_TX (out)

### Nets
+3V3: C22.2 J4.2 R24.2 U6.12(+3.3V)
GND: C22.1 C23.2 D8.2(K) J4.3 S3.1 S3.4 U6.13(GND) U6.14(GND) U6.21(GND) U6.22(GND)
BLE_BRK: C23.1 J4.6 R24.1 S3.2 S3.3 U6.23(KEY)
BLE_RX: J4.5 JP3.1 ; port BLE_RX
BLE_STATE: J4.1 R23.1 U6.24(LED)
BLE_TX: J4.4 JP2.1 ; port BLE_TX
NetD8_1: D8.1(A) R23.2
NetJP2_2: JP2.2 U6.1(UART_TX)
NetJP3_2: JP3.2 U6.2(UART_RX)

Not connected (* = marked no-connect by the designer): U6 3(UART_CTS)* 4(UART_RTS)* 5(NC5)* 6(NC6)* 7(NC7)* 8(NC8)* 9(NC9)* 10(NC10)* 11(RESET)* 15(USB_D-)* 16(NC16)* 17(NC17)* 18(NC18)* 19(NC19)* 20(USB_D+)* 25(PIO2)* 26(PIO3)* 27(PIO4)* 28(PIO5)* 29(PIO6)* 30(PIO7)* 31(PIO8)* 32(PIO9)* 33(PIO10)* 34(PIO11)*

### Notes on the sheet
- https://www.electronicproducts.com/hands-on-review-hm-10-ble-module-and-its-mysterious-clones/
- Will work from 3.3V ? -> Check ?
- (near JP2) Jumpers ON -> MCU to HM10
  Jumpers OFF -> Can access uart pins of both MCU and HM10
- (near J4) Check proper orientation of pins ?
- Title :
- Size:
- Date:
- Page :
- A4
- Number:
- Time:
- Revision:
- Sheet
- of
- Sheet Name :
- Drawn By :

### Library data of the parts
C22 = Cap: Capacitor; Voltage Rating: 16V; MF: *; MP: *; JLCPCB: *
C23 = Cap: Capacitor; MF: *; MP: *; JLCPCB: *
D8 = LED: Light Emitting Diode; Manufacturer: *; Manufacturer part number: *; JLCPCB part number: *
J4 = 6 Pin: as J3 on sheet 2.mcu; ComponentLink1Description: Datasheet; ComponentLink1URL: https://cdn.harwin.com/pdfs/C001XX_M20_Series_Connectors.pdf; ComponentLink2Description: DigiKey Link; ComponentLink2URL: https://www.digikey.com/en/products/detail/harwin-inc/M20-7820642/3727776; Contact Finish - Mating: Gold; Contact Finish - Post: Tin; Contact Finish Thickness - Mating: Flash; Contact Type: Female Socket; Fastening Type: Push-Pull; Insulation Color: Black; Insulation Height: 0.335" (8.51mm); LastUpdated: 9/21/2022 6:58:09 PM; Lifecycle Status: Active; Minimum Order: 1; Mounting Type: Through Hole; Number of Rows: 1; Operating Temperature: -40°C ~ 105°C; Packaging: Tube; Part Status: Active; Price: 0.55; Series: M20; Supplier 1: DigiKey; Supplier Part Number 1: 952-1808-ND; Termination: Solder
JP2 JP3 = 2 Pin Jumper_Series: 2 Pin Jumper - place in series with wires.; Part Number: NC6-P108-03; Manufacturer: TE Connectivity AMP Connectors; Barrier Type: 2 Wall (Dual); Bottom Termination: PC Pin; Current Rating (Amps): 20A; Number of Circuits: 3; Pitch: 0.375" (9.53mm); Top Termination: Screws with Captive Plate; Voltage Rating: 300V; Wire Gauge: 12-22 AWG; Color: Black; ComponentLink1Description: Datasheet; ComponentLink1URL: https://www.te.com/commerce/DocumentDelivery/DDEController?Action=srchrtrv&DocNm=3-1437664-0&DocType=Customer+Drawing&DocLang=English; ComponentLink2Description: DigiKey Link; ComponentLink2URL: http://digikey.com/product-detail/en/te-connectivity-amp-connectors/NC6-P108-03/A98496-ND/1277927; LastUpdated: 1/15/2020 4:12:05 AM; Lifecycle Status: Active; Minimum Order: 1; Number of Rows: 1; Number of Wire Entries: 3; Packaging: Bulk; Part Status: Active; Price: 2.16; Series: NC6, Buchanan; Supplier 1: DigiKey; Supplier Part Number 1: A98496-ND; Terminal Block Type: Barrier Block
R23 R24 = Res: Resistor; Manufacturer: *; Manufacturer part number: *; JLCPCB part number: *
S3 = SPST-NO 4 PIN: Switch Push button
U6 = HM-10: Bluetooth 4.0 module with 4pin base board that can support iphone4s or later.; MF: Jinan Huamao Technology; SnapEDA_Link: https://www.snapeda.com/parts/HM-10/Jinan+Huamao+Technology/view-part/?ref=snap; Package: Package; Value: *; MP: HM-10; Check_prices: https://www.snapeda.com/parts/HM-10/Jinan+Huamao+Technology/view-part/?ref=eda

## Sheet 5.gpio.SchDoc: IndoorGuide_Tag_Device_V1.0.0
size A4; DocumentNumber: 6; SheetNumber: 6; SheetTotal: 6; Page: GPIO

### Notes on the sheet
- Title :
- Size:
- Date:
- Page :
- A4
- Number:
- Time:
- Revision:
- Sheet
- of
- Sheet Name :
- Drawn By :

## Sheet 6.imu.SchDoc: IndoorGuide_Tag_Device_V1.0.0
size A4; DocumentNumber: 7; SheetNumber: 7; SheetTotal: 8; Page: IMU
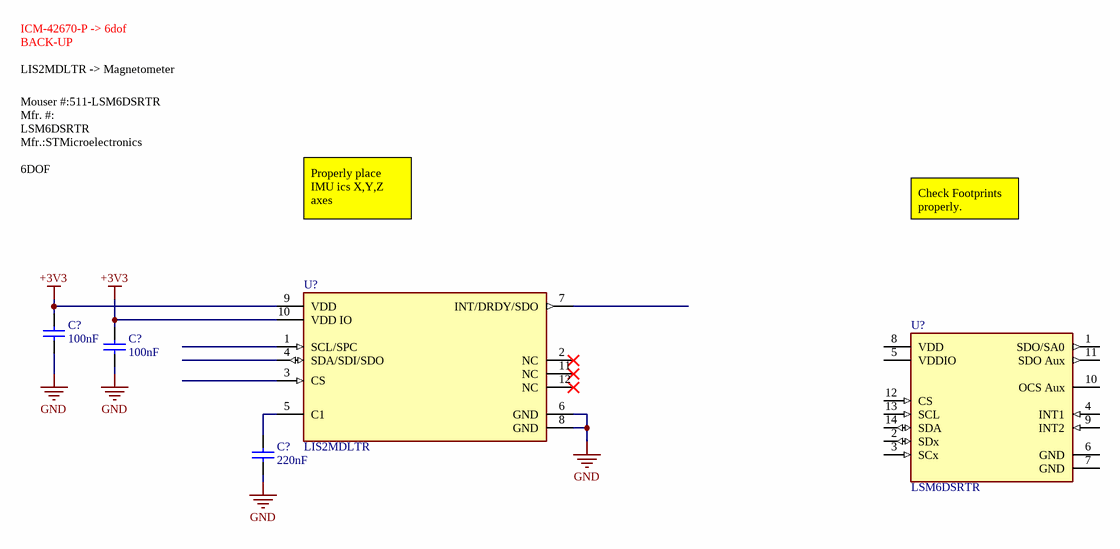
[diagram p5: 6.imu.SchDoc]

### Parts
(Parts that share a designator on the sheet are numbered #1, #2 ... from top to bottom, then left to right.)
C?#1  100nF  [cap0603]
C?#2  100nF  [cap0603]
C?#3  220nF  [cap0603]
U?#1  LIS2MDLTR  [FP-LGA-12-DM00170568-MFG]
U?#2  LSM6DSRTR  [FP-LGA-14L-DM00249496-MFG]

### Nets
+3V3: C?#1.2 C?#2.2 U?#1.9(VDD) U?#1.10(VDD_IO)
GND: C?#1.1 C?#2.1 C?#3.1 U?#1.6(GND) U?#1.8(GND)
NetC?#3_2: C?#3.2 U?#1.5(C1)

Not connected (* = marked no-connect by the designer): U?#1 1(SCL/SPC) 2(NC)* 3(CS) 4(SDA/SDI/SDO) 7(INT/DRDY/SDO) 11(NC)* 12(NC)*; U?#2 1(SDO/SA0) 2(SDx) 3(SCx) 4(INT1) 5(VDDIO) 6(GND) 7(GND) 8(VDD) 9(INT2) 10(OCS_Aux) 11(SDO_Aux) 12(CS) 13(SCL) 14(SDA)

### Notes on the sheet
- LIS2MDLTR -> Magnetometer
- ICM-42670-P -> 6dof
  BACK-UP
- Mouser #:511-LSM6DSRTR
  Mfr. #:
  LSM6DSRTR
  Mfr.:STMicroelectronics
  6DOF
- Properly place IMU ics X,Y,Z axes
- Check Footprints
  properly.
- Title :
- Size:
- Date:
- Page :
- A4
- Number:
- Time:
- Revision:
- Sheet
- of
- Sheet Name :
- Drawn By :

### Library data of the parts
C?#1-C?#3 = Cap: Capacitor; Voltage Rating: 16V; MF: *; MP: *; JLCPCB: *
U?#1 = LIS2MDLTR: SENSOR MR I2C/SPI 12LGA; Manufacturer: STMicroelectronics; Sensing Method: Magnetic; Min Supply Voltage: 1.71V; Sensor Output: I2C,SPI; Operating Supply Current: 50-200uA; Max Supply Voltage: 3.6V; Octopart: https://octopart.com/lis2mdltr-stmicroelectronics-81117311; RoHS: TRUE; Device Class L3: unset; Device Class L1: Sensors; ComponentLink2URL: https://www.st.com/resource/en/datasheet/lis2mdl.pdf; Automotive: No; Device Class L2: Magnetic Sensors; Lead Free: Yes; Temperature: -40°C to +85°C; Manufacturer Part Number: LIS2MDLTR; Temperature Range High: +85°C; Height: 0.7mm; Digikey Description: SENSOR MR I2C/SPI 12LGA; Category: IC; ComponentLink2Description: Datasheet; Package: LGA-12-DM00170568; Temperature Range Low: -40°C
U?#2 = LSM6DSRTR: INEMO INERTIAL MODULE: 3D ACCELE; Manufacturer: STMicroelectronics; Sensor Output: I2C,SPI; Accel Range: 2/4/8/16g; Gyro Range: 125/250/500/1000/2000/4000°/s; Operating Supply Current: 360-1200uA; Max Supply Voltage: 3.6V; Min Supply Voltage: 1.62V; Sensor Type: Temperature,Accelerometer,Gyroscope; Device Class L3: Inertial Measurement Units (IMUs); Package: LGA-14L-DM00249496; ComponentLink2Description: Datasheet; Mouser Description: In a Pack of 2, LSM6DSRTR STMicroelectronics, 3-Axis Accelerometer, Gyroscope, 14-Pin LGA; Footprint Url: https://www.st.com/content/ccc/resource/technical/document/technical_note/73/17/9c/16/dd/96/4a/01/CD00134799.pdf/files/CD00134799.pdf/jcr:content/translations/en.CD00134799.pdf; RoHS: TRUE; Automotive: No; Temperature Range High: +85°C; Digikey Description: INEMO INERTIAL MODULE: 3D ACCELE; Manufacturer Part Number: LSM6DSRTR; ComponentLink2URL: https://www.st.com/resource/en/datasheet/lsm6dsr.pdf; Lead Free: Yes; Category: IC; Temperature Range Low: -40°C; Height: 0.86mm; Octopart: https://octopart.com/lsm6dsrtr-stmicroelectronics-93180177; Temperature: -40°C to +85°C; Device Class L1: Sensors; Device Class L2: Motion Sensors

## Sheet 7.mechanical_hw.SchDoc: IndoorGuide_Tag_Device_V1.0.0
size A4; Organization: Electronic and Telecommunication Department - University of Moratuwa; Address1: Bandaranayake Mawatha; Address2: Moratuwa; Address3: Sri Lanka; Address4: 10400; DocumentNumber: 8; SheetNumber: 8; SheetTotal: 8; Page: Mechanical
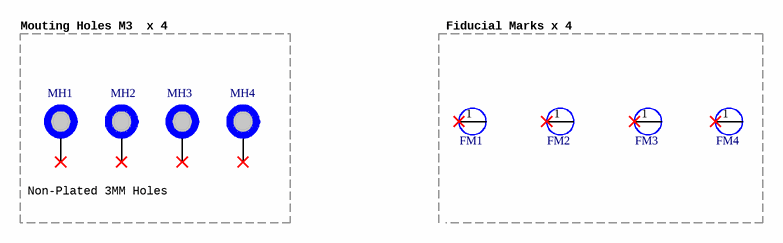
[diagram p6: 7.mechanical_hw.SchDoc]

### Parts
FM1  FM  [FM]  (value not drawn)
FM2  FM  [FM]  (value not drawn)
FM3  FM  [FM]  (value not drawn)
FM4  FM  [FM]  (value not drawn)
MH1  MH_7.4MMC_3.2MMD  [MECHANICAL_M3_NON_PLATED]  (value not drawn)  (no BOM)
MH2  MH_7.4MMC_3.2MMD  [MECHANICAL_M3_NON_PLATED]  (value not drawn)  (no BOM)
MH3  MH_7.4MMC_3.2MMD  [MECHANICAL_M3_NON_PLATED]  (value not drawn)  (no BOM)
MH4  MH_7.4MMC_3.2MMD  [MECHANICAL_M3_NON_PLATED]  (value not drawn)  (no BOM)

### Blocks framed on the sheet
Mouting Holes M3  x 4: MH1-MH4

### Nets

Not connected (* = marked no-connect by the designer): FM1 1(FM)*; FM2 1(FM)*; FM3 1(FM)*; FM4 1(FM)*; MH1 1*; MH2 1*; MH3 1*; MH4 1*

### Notes on the sheet
- Fiducial Marks x 4
- Non-Plated 3MM Holes
- Title :
- Size:
- Date:
- Page :
- A4
- Number:
- Time:
- Revision:
- Sheet
- of
- Sheet Name :
- Drawn By :

### Library data of the parts
FM1-FM4 = FM: Fiducial mark; Value: *; Parameter 1: *
MH1-MH4 = Mounting_Hole2: Mounting Hole 7.4mm Diameter, 3.2mm Drill

## Nets that join several sheets
+3V3: 1.power (SB3.2), 2.mcu (12 pins), 3.dwm3000 (5 pins), 4.ble (C22.2 J4.2 R24.2 U6.12), 6.imu (C?#1.2 C?#2.2 U?#1.9 U?#1.10)
GND: 1.power (26 pins), 2.mcu (23 pins), 3.dwm3000 (11 pins), 4.ble (10 pins), 6.imu (5 pins)